# Altium project Final_Project_Assignment.PrjPcb
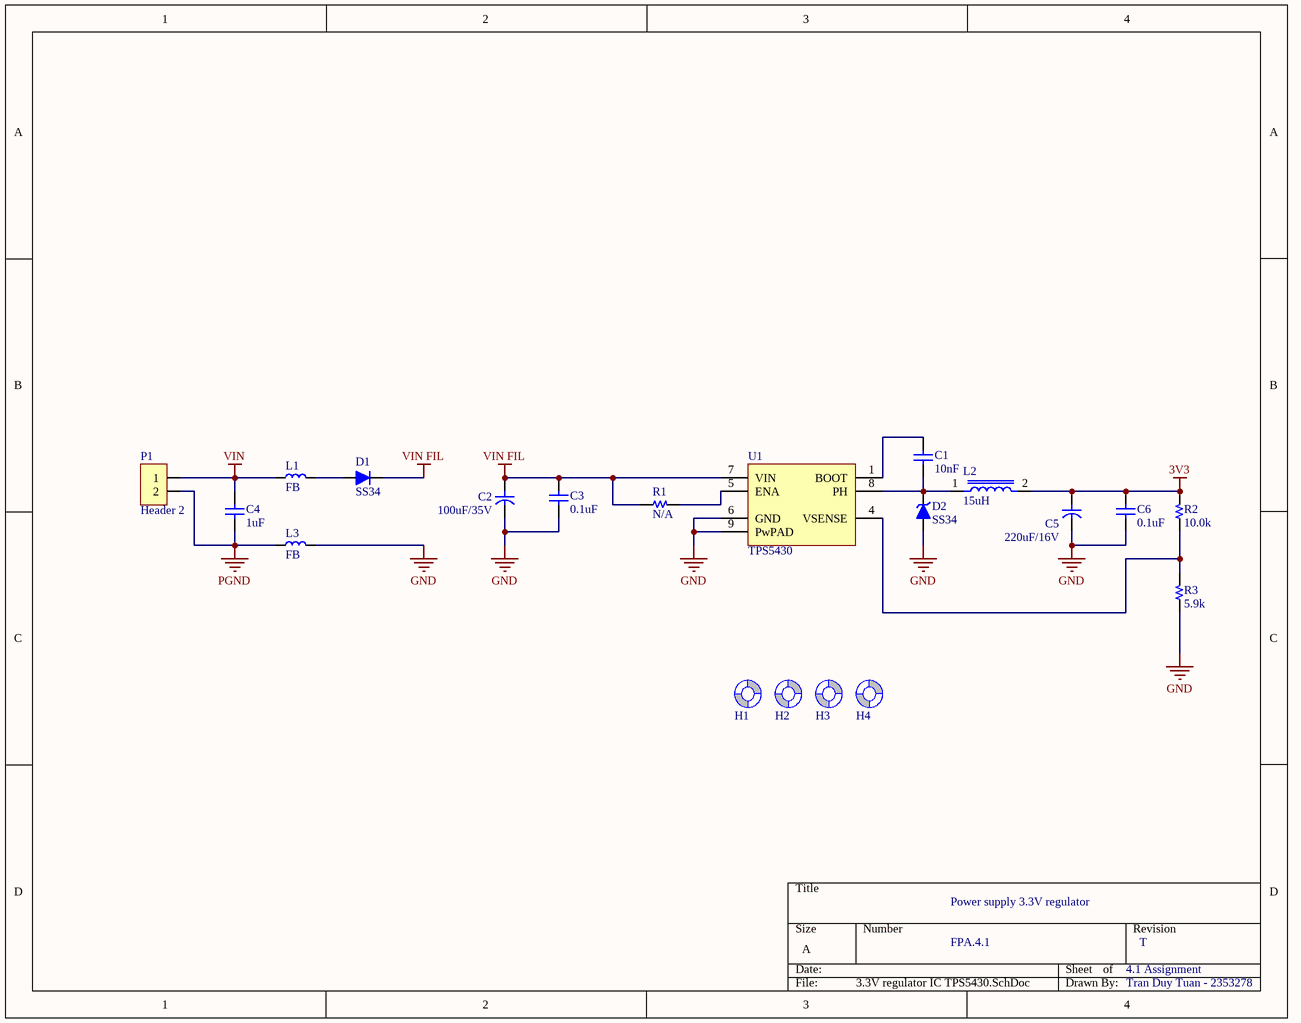
[diagram p0: 3.3V regulator IC TPS5430.SchDoc]
6 sheets, 61 parts. Net scope: global (net labels, ports and power ports of the same name join across sheets).
Board file: PCB_FinalResult.PcbDoc
Sheets:
  3.3V regulator IC TPS5430.SchDoc
  ESP32_WROM_32 part.SchDoc
  Slide Switch with an MCU.SchDoc
  Current sensor circuit.SchDoc
  RS-485.SchDoc
  High-currenr LEDs.SchDoc

## Sheet 3.3V regulator IC TPS5430.SchDoc
size A; SheetNumber: 1; SheetTotal: 6

### Parts
C1  10nF  [C 0805]
C2  100uF/35V  [CYL/D.500/LS.200]
C3  0.1uF  [C 0805]
C4  1uF  [C 0805]
C5  220uF/16V  [CYL/D.500/LS.200]
C6  0.1uF  [C 0805]
D1  SS34  [DO-214AC (SMA)]
D2  SS34  [DO-214AC (SMA)]
H1  Screw Hole  [SCREW/3.2/7.0/M]  (value not drawn)  (no BOM)
H2  Screw Hole  [SCREW/3.2/7.0/M]  (value not drawn)  (no BOM)
H3  Screw Hole  [SCREW/3.2/7.0/M]  (value not drawn)  (no BOM)
H4  Screw Hole  [SCREW/3.2/7.0/M]  (value not drawn)  (no BOM)
L1  FB  [L 0805 (2012)]
L2  15uH  [IND_SRP6540-150M]
L3  FB  [L 0805 (2012)]
P1  Header 2  [HDR/Header/2/VH]
R1  N/A  [R 0603]
R2  10.0k  [R 0603]
R3  5.9k  [R 0603]
U1  TPS5430  [SOIC-8 EP]

### Nets
3V3: C5.1 C6.1 L2.2 R2.2
GND: C2.2 C3.2 C5.2 C6.2 D2.1(A) L3.2 R3.1 U1.6(GND) U1.9(PwPAD)
PGND: C4.2 L3.1 P1.2
VIN: C4.1 L1.1 P1.1
VIN FIL: C2.1 C3.1 D1.2(K) R1.1 U1.7(VIN)
NetC1_1: C1.1 U1.1(BOOT)
NetC1_2: C1.2 D2.2(K) L2.1 U1.8(PH)
NetD1_1: D1.1(A) L1.2
NetR1_2: R1.2 U1.5(ENA)
NetR2_1: R2.1 R3.2 U1.4(VSENSE)

Not connected (* = marked no-connect by the designer): H1 1(Screw); H2 1(Screw); H3 1(Screw); H4 1(Screw)

### Notes on the sheet
- Power supply 3.3V regulator
- FPA.4.1
- 4.1 Assignment
- T
- Tran Duy Tuan - 2353278

### Library data of the parts
C1 C3 C4 C6 = Capacitor NP: Capacitor non-pol
C2 C5 = Capacitor: Capacitor pol
D1 = Diode: Default Diode
D2 = Diode Zener: Zener Diode
L1 L3 = Inductor
L2 = SRP6540-150M: 15ÂµH Shielded Wirewound Inductor 2.9A 121mOhm Max Nonstandard; MF: Bourns; Digi-Key_Part_Number: SRP6540-150MCT-ND; Check_prices: https://www.snapeda.com/parts/SRP6540-150M/Bourns/view-part/613418/?ref=eda; Value: *; Package: Nonstandard Bourns; Purchase-URL: https://pricing.snapeda.com/search/part/SRP6540-150M/?ref=eda; MP: SRP6540-150M; SnapEDA_Link: https://www.snapeda.com/parts/SRP6540-150M/Bourns/view-part/613418/?ref=snap
P1 = Header 2: Header, 2-Pin
R1-R3 = Resistor
U1 = TPS54xx: 3/5A, Wide input range, Step-down SWIFT DC-DC Converter
H1-H4 = Screw Hole: TYPE: NO-BOM; UNIT PRICE: 0

## Sheet ESP32_WROM_32 part.SchDoc
size A; SheetNumber: 2; SheetTotal: 4
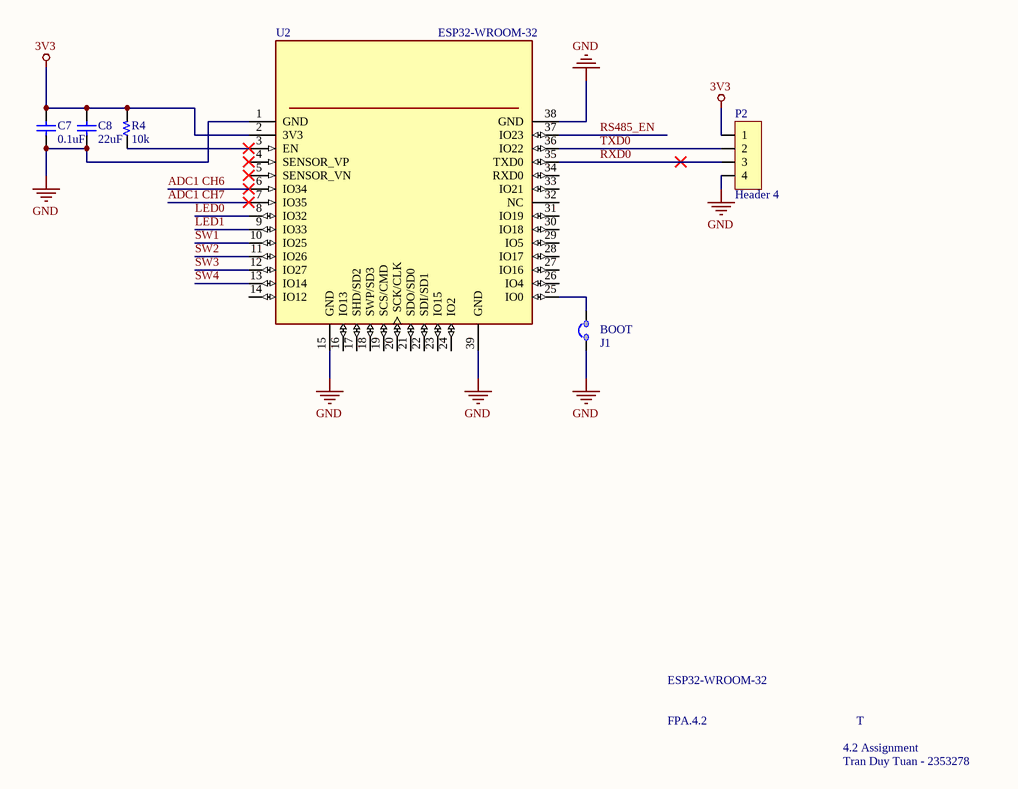
[diagram p1: ESP32_WROM_32 part.SchDoc]

### Parts
C7  0.1uF  [C 0805]
C8  22uF  [C 0805]
J1  JUMP 2  [JUMP/2/Close]  (value not drawn)  (no BOM)
P2  Header 4  [HDR/Header/4]
R4  10k  [R 0805]
U2  ESP32-WROOM-32  [MODULE_ESP32-WROOM-32]

### Nets
3V3: C7.1 C8.1 P2.1 R4.2 U2.2(3V3)
GND: C7.2 C8.2 J1.1 P2.4 U2.1(GND) U2.15(GND) U2.38(GND) U2.39(GND)
ADC1 CH6: U2.6(IO34)
ADC1 CH7: U2.7(IO35)
LED0: U2.8(IO32)
LED1: U2.9(IO33)
RS485_EN: U2.37(IO23)
RXD0: P2.3 U2.35(TXD0)
SW1: U2.10(IO25)
SW2: U2.11(IO26)
SW3: U2.12(IO27)
SW4: U2.13(IO14)
TXD0: P2.2 U2.36(IO22)
NetJ1_2: J1.2 U2.25(IO0)
NetR4_1: R4.1 U2.3(EN)

Not connected (* = marked no-connect by the designer): U2 4(SENSOR_VP)* 5(SENSOR_VN)* 14(IO12) 16(IO13) 17(SHD/SD2) 18(SWP/SD3) 19(SCS/CMD) 20(SCK/CLK) 21(SDO/SD0) 22(SDI/SD1) 23(IO15) 24(IO2) 26(IO4) 27(IO16) 28(IO17) 29(IO5) 30(IO18) 31(IO19) 32(NC) 33(IO21) 34(RXD0)

### Notes on the sheet
- (near J1) BOOT
- ESP32-WROOM-32
- FPA.4.2
- 4.2 Assignment
- T
- Tran Duy Tuan - 2353278

### Library data of the parts
C7 C8 = Capacitor NP: Capacitor non-pol
P2 = Header 4: Header, 4-Pin
R4 = Resistor
U2 = ESP32-WROOM-32: Bluetooth, WiFi 802.11b/g/n, Bluetooth v4.2 + EDR, Class 1, 2 and 3 Transceiver Module 2.4GHz ~ 2.5GHz Integrated, Trace Surface Mount; MF: Espressif Systems; MP: ESP32-WROOM-32D; Price: None; Package: Module Espressif Systems; Availability: Unavailable; SnapEDA_Link: https://www.snapeda.com/parts/ESP32-WROOM-32D/Espressif%20Systems/view-part/2768115/?ref=snap; Value: *

## Sheet Slide Switch with an MCU.SchDoc
size A; SheetNumber: 3; SheetTotal: 6
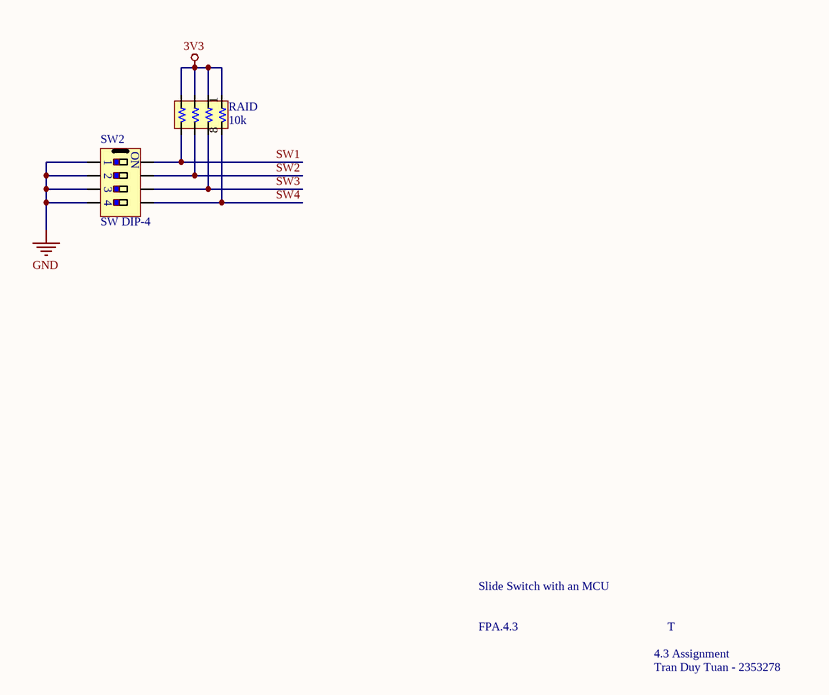
[diagram p2: Slide Switch with an MCU.SchDoc]

### Parts
RAID  10k  [RA4 1206 (3216)]
SW2  SW DIP-4  [SW/DIP4]

### Nets
3V3: RAID.1 RAID.2 RAID.3 RAID.4
GND: SW2.1 SW2.2 SW2.3 SW2.4
SW1: RAID.5 SW2.8
SW2: RAID.6 SW2.7
SW3: RAID.7 SW2.6
SW4: RAID.8 SW2.5

### Notes on the sheet
- Slide Switch with an MCU
- FPA.4.3
- 4.3 Assignment
- T
- Tran Duy Tuan - 2353278
- (in symbol SW DIP-4) ON

### Library data of the parts
RAID = Resistor Array 4

## Sheet Current sensor circuit.SchDoc
size A; SheetNumber: 4; SheetTotal: 6
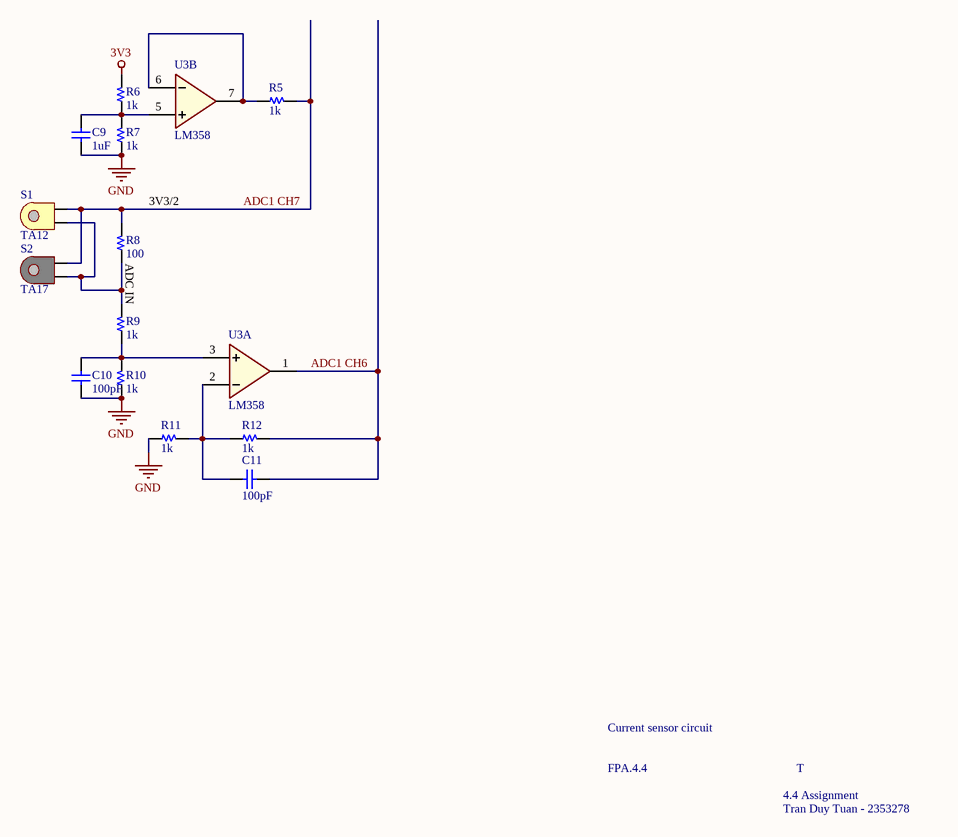
[diagram p3: Current sensor circuit.SchDoc]

### Parts
C9  1uF  [C 0805]
C10  100pF  [C 0805]
C11  100pF  [C 0805]
R5  1k  [R 0805]
R6  1k  [R 0805]
R7  1k  [R 0805]
R8  100  [R 0805]
R9  1k  [R 0805]
R10  1k  [R 0805]
R11  1k  [R 0805]
R12  1k  [R 0805]
S1  TA12  [TA12]
S2  TA17  [TA17]
U3  LM358  [SOIC-8]  (parts A,B of 2)

### Nets
3V3: R6.2
GND: C9.2 C10.2 R7.1 R10.1 R11.1 U3.4(GND)
VCC: U3.8(VCC)
ADC1 CH6: C11.2 R12.2 U3.1(OutA)
ADC1 CH7: R5.2 R8.2 S1.1 S2.1
NetC9_1: C9.1 R6.1 R7.2 U3.5(B+)
NetC10_1: C10.1 R9.1 R10.2 U3.3(A+)
NetC11_1: C11.1 R11.2 R12.1 U3.2(A-)
NetR5_1: R5.1 U3.6(B-) U3.7(OutB)
NetR8_1: R8.1 R9.2 S1.2 S2.2

### Notes on the sheet
- ADC IN
- 3V3/2
- Current sensor circuit
- FPA.4.4
- 4.4 Assignment
- T
- Tran Duy Tuan - 2353278

### Library data of the parts
C9-C11 = Capacitor NP: Capacitor non-pol
R5-R12 = Resistor
U3 = LM358: Low Power Dual Operational Amplifiers

## Sheet RS-485.SchDoc
size A; SheetNumber: 5; SheetTotal: 5
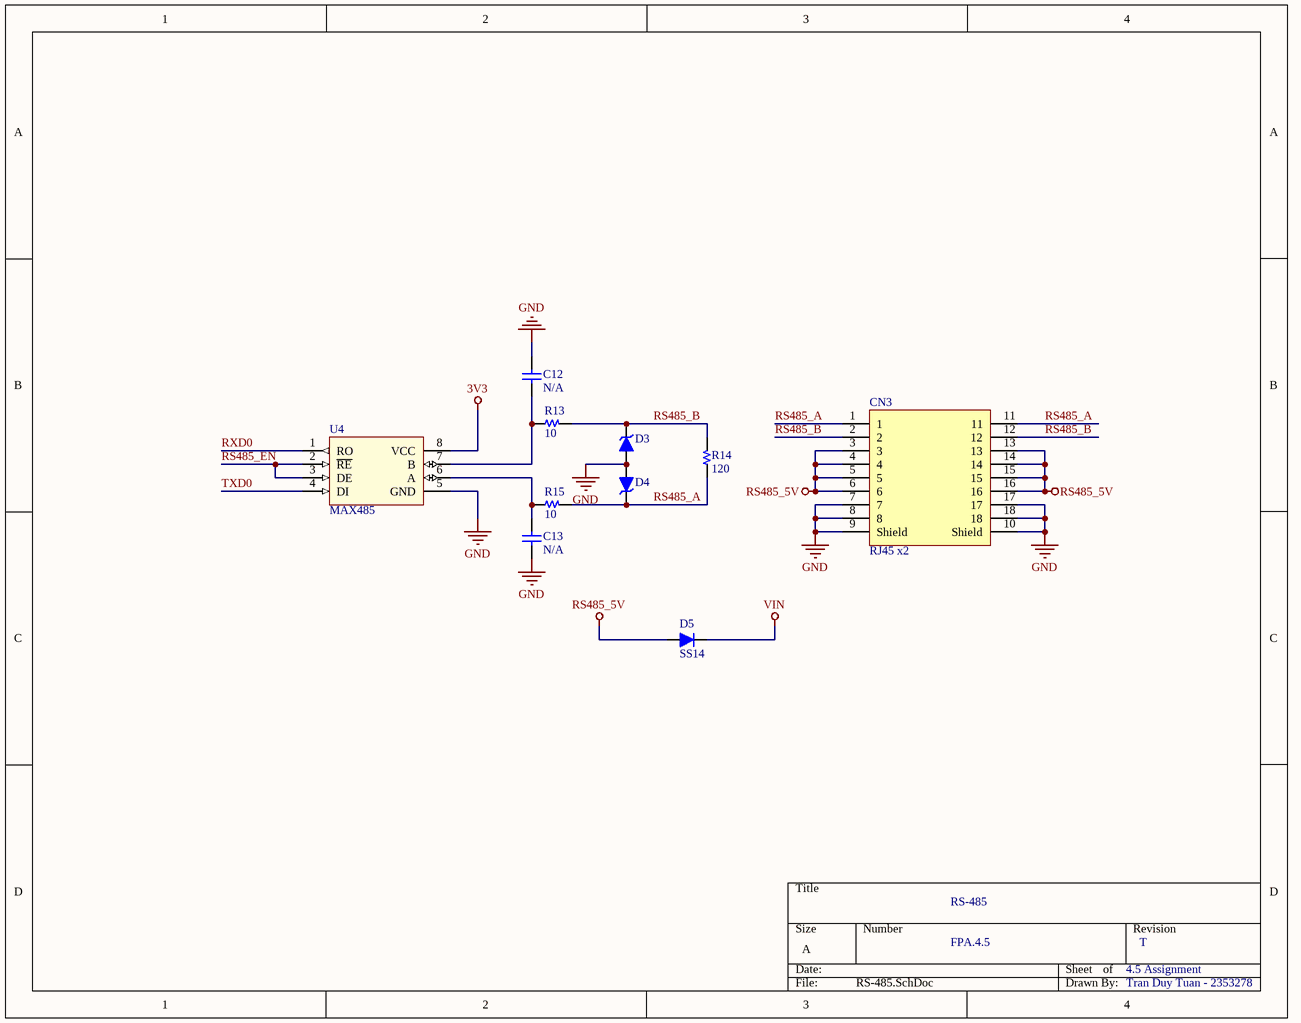
[diagram p4: RS-485.SchDoc]

### Parts
C12  N/A  [C 0805]
C13  N/A  [C 0805]
CN3  RJ45 x2  [CONN/RJ45/x2]
D3  (no value)  [DO-41]
D4  (no value)  [DO-41]
D5  SS14  [DO-41]
R13  10  [R 0805]
R14  120  [R 0805]
R15  10  [R 0805]
U4  MAX485  [SOIC-8]

### Nets
3V3: U4.8(VCC)
GND: C12.1 C13.2 CN3.7 CN3.8 CN3.9(Shield) CN3.10(Shield) CN3.17 CN3.18 D3.1(A) D4.1(A) U4.5(GND)
RS485_5V: CN3.3 CN3.4 CN3.5 CN3.6 CN3.13 CN3.14 CN3.15 CN3.16 D5.1(A)
VIN: D5.2(K)
RS485_A: CN3.1 CN3.11 D4.2(K) R14.1 R15.2
RS485_B: CN3.2 CN3.12 D3.2(K) R13.2 R14.2
RS485_EN: U4.2(~{RE}) U4.3(DE)
RXD0: U4.1(RO)
TXD0: U4.4(DI)
NetC12_2: C12.2 R13.1 U4.7(B)
NetC13_1: C13.1 R15.1 U4.6(A)

### Notes on the sheet
- RS-485
- FPA.4.5
- 4.5 Assignment
- T
- Tran Duy Tuan - 2353278

### Library data of the parts
C12 C13 = Capacitor NP: Capacitor non-pol
CN3 = CON RJ45 x2: Connector RJ45 X2
D3 D4 = Diode Zener: Zener Diode
D5 = Diode: Default Diode
R13-R15 = Resistor
U4 = MAX485: Low-Power, Slew-Rate-Limited  RS-485/RS-422 Transceivers

## Sheet High-currenr LEDs.SchDoc
size A; SheetNumber: 6; SheetTotal: 6
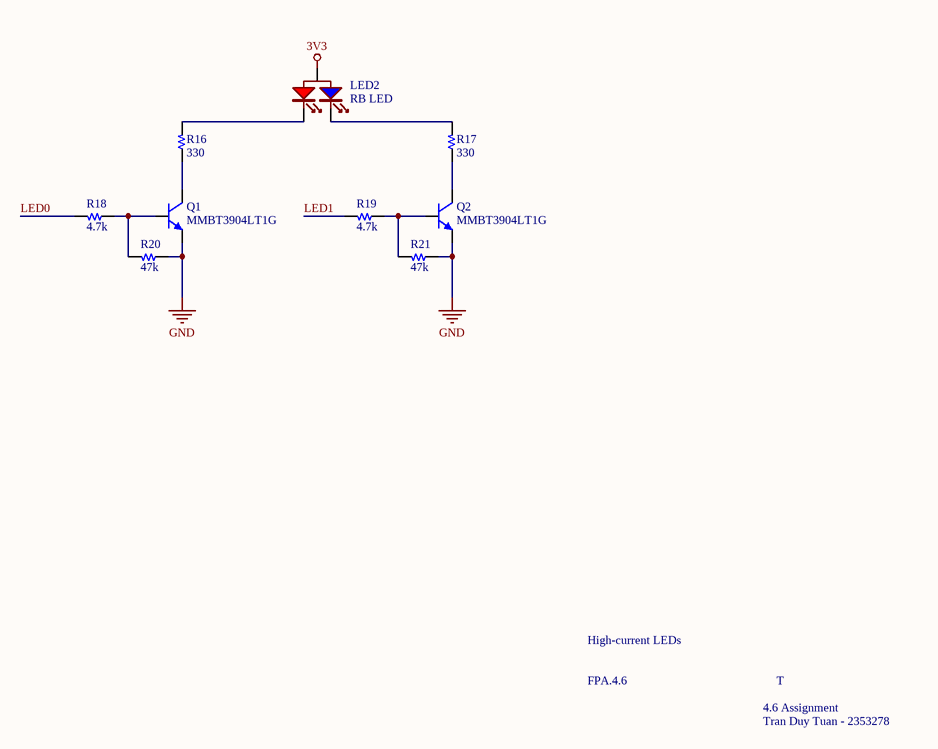
[diagram p5: High-currenr LEDs.SchDoc]

### Parts
LED2  RB LED  [LED-BICOLOR-3MM]
Q1  MMBT3904LT1G  [TO-92/W100]
Q2  MMBT3904LT1G  [TO-92/W100]
R16  330  [R 0805]
R17  330  [R 0805]
R18  4.7k  [R 0805]
R19  4.7k  [R 0805]
R20  47k  [R 0805]
R21  47k  [R 0805]

### Nets
3V3: LED2.2(A)
GND: Q1.2(E) Q2.2(E) R20.1 R21.1
LED0: R18.2
LED1: R19.2
NetLED2_1: LED2.1(K1) R16.2
NetLED2_3: LED2.3(K2) R17.2
NetQ1_1: Q1.1(B) R18.1 R20.2
NetQ1_3: Q1.3(C) R16.1
NetQ2_1: Q2.1(B) R19.1 R21.2
NetQ2_3: Q2.3(C) R17.1

### Notes on the sheet
- High-current LEDs
- FPA.4.6
- 4.6 Assignment
- T
- Tran Duy Tuan - 2353278

### Library data of the parts
LED2 = LED 2-color-A: Bicolor RB 3mm LED
Q1 Q2 = Transistor NPN: NPN Bipolar Transistor; pin to pad: 1>3 2>1 3>2
R16-R21 = Resistor

## Nets that join several sheets
3V3: 3.3V regulator IC TPS5430 (C5.1 C6.1 L2.2 R2.2), ESP32_WROM_32 part (5 pins), Slide Switch with an MCU (RAID.1 RAID.2 RAID.3 RAID.4), Current sensor circuit (R6.2), RS-485 (U4.8), High-currenr LEDs (LED2.2)
GND: 3.3V regulator IC TPS5430 (9 pins), ESP32_WROM_32 part (8 pins), Slide Switch with an MCU (SW2.1 SW2.2 SW2.3 SW2.4), Current sensor circuit (6 pins), RS-485 (11 pins), High-currenr LEDs (Q1.2 Q2.2 R20.1 R21.1)
VIN: 3.3V regulator IC TPS5430 (C4.1 L1.1 P1.1), RS-485 (D5.2)
ADC1 CH6: ESP32_WROM_32 part (U2.6), Current sensor circuit (C11.2 R12.2 U3.1)
ADC1 CH7: ESP32_WROM_32 part (U2.7), Current sensor circuit (R5.2 R8.2 S1.1 S2.1)
LED0: ESP32_WROM_32 part (U2.8), High-currenr LEDs (R18.2)
LED1: ESP32_WROM_32 part (U2.9), High-currenr LEDs (R19.2)
RS485_EN: ESP32_WROM_32 part (U2.37), RS-485 (U4.2 U4.3)
RXD0: ESP32_WROM_32 part (P2.3 U2.35), RS-485 (U4.1)
SW1: ESP32_WROM_32 part (U2.10), Slide Switch with an MCU (RAID.5 SW2.8)
SW2: ESP32_WROM_32 part (U2.11), Slide Switch with an MCU (RAID.6 SW2.7)
SW3: ESP32_WROM_32 part (U2.12), Slide Switch with an MCU (RAID.7 SW2.6)
SW4: ESP32_WROM_32 part (U2.13), Slide Switch with an MCU (RAID.8 SW2.5)
TXD0: ESP32_WROM_32 part (P2.2 U2.36), RS-485 (U4.4)